# Altium schematic sheet CW341_FPGA_CFG.SchDoc: Kintex CFG
size Letter; Organization: NewAE Technology Inc.; Address1: 1083 Queen St., Suite 196; Address2: Halifax; Address3: NS; Address4: Canada B3H 0B2; SheetNumber: 4; SheetTotal: 16; SheetApproved: YES
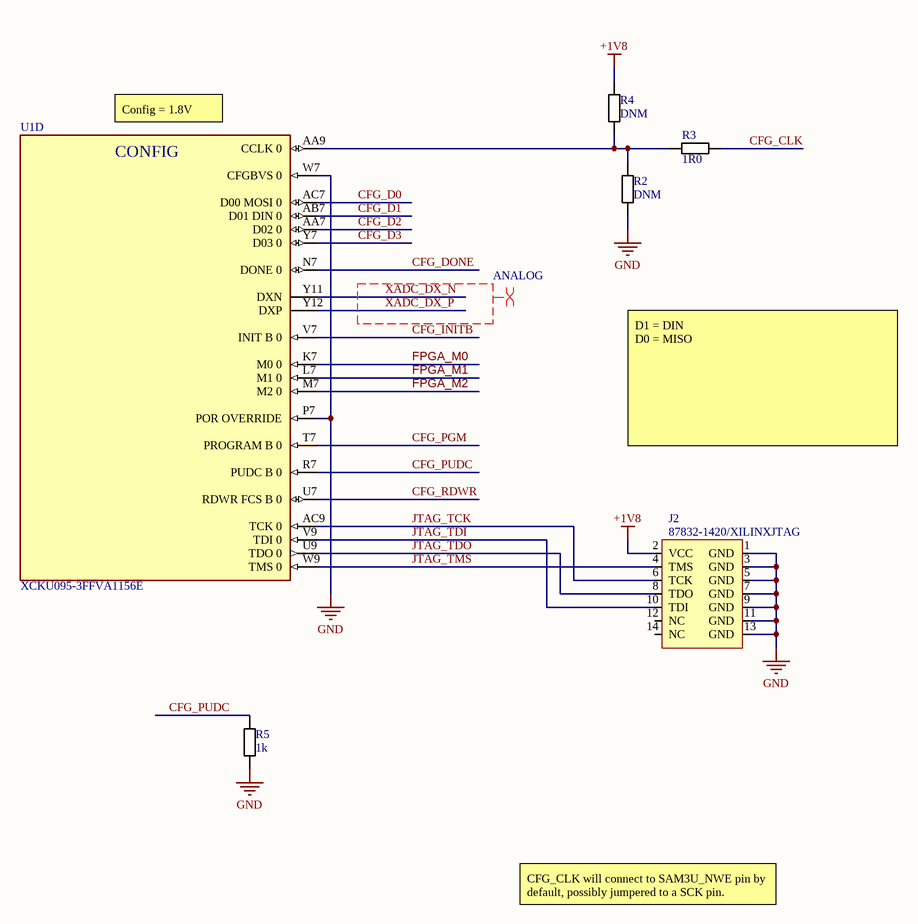
[diagram p0: CW341_FPGA_CFG.SchDoc]

## Parts
J2  87832-1420/XILINXJTAG  [87832-1420]
R2  DNM  [RESC1005X40N]
R3  1R0  [RESC1005X40N]
R4  DNM  [RESC1005X40N]
R5  1k  [RESC1005X40N]
U1  XCKU095-3FFVA1156E  [FP-XCKU060-3FFVA1156E-MFG]  (part D of 23)

## Nets
+1V8: J2.2(VCC) R4.1
GND: J2.1(GND) J2.3(GND) J2.5(GND) J2.7(GND) J2.9(GND) J2.11(GND) J2.13(GND) R2.2 R5.2 U1.P7(POR_OVERRIDE) U1.W7(CFGBVS_0)
CFG_CLK: R3.2
CFG_D0: U1.AC7(D00_MOSI_0)
CFG_D1: U1.AB7(D01_DIN_0)
CFG_D2: U1.AA7(D02_0)
CFG_D3: U1.Y7(D03_0)
CFG_DONE: U1.N7(DONE_0)
CFG_INITB: U1.V7(INIT_B_0)
CFG_PGM: U1.T7(PROGRAM_B_0)
CFG_PUDC: R5.1 U1.R7(PUDC_B_0)
CFG_RDWR: U1.U7(RDWR_FCS_B_0)
FPGA_M0: U1.K7(M0_0)
FPGA_M1: U1.L7(M1_0)
FPGA_M2: U1.M7(M2_0)
JTAG_TCK: J2.6(TCK) U1.AC9(TCK_0)
JTAG_TDI: J2.10(TDI) U1.V9(TDI_0)
JTAG_TDO: J2.8(TDO) U1.U9(TDO_0)
JTAG_TMS: J2.4(TMS) U1.W9(TMS_0)
XADC_DX_N: U1.Y11(DXN)
XADC_DX_P: U1.Y12(DXP)
NetR2_1: R2.1 R3.1 R4.2 U1.AA9(CCLK_0)

Not connected (* = marked no-connect by the designer): J2 12(NC) 14(NC)

## Layout directives
differential pair; differential pair class ANALOG: XADC_DX_N, XADC_DX_P

## Notes on the sheet
- Config = 1.8V
- D1 = DIN
  D0 = MISO
- CFG_CLK will connect to SAM3U_NWE pin by default, possibly jumpered to a SCK pin.
- Title:
- Date:
- Rev:
- Time:
- Project:
- Sheet
- of
- License:
- Copyright © NewAE Technology Inc.
- Approved:
- NewAE.com
- File:
- (in symbol IC-XCKU095-1156, part D) CONFIG

## Library data of the parts
J2 = 87832-1420/XILINXJTAG: Molex 14-pin SMD, JTAG Pinout; Manufacture 1: Molex; Manufacture 1 Part Number: 87832-1420; Supplier 1: Digi-Key; Supplier Part Number 1: WM18641-ND
R2 R4 = RCHIP-DNM-0402: Component Group: Resistor; Case-EIA: 0402; Case-Metric: 1005; Part Number: RCHIP-DNM-0402; Footprint: 0402; Pin Count: 2; Value: DNM; Component Kind: Standard; Component Type: Standard
R3 = RCHIP-1R0-0402: 1R0 res, 0402, 1%, 1/16W; Manufacture 1: Yageo; Manufacture Part Number 1: RC0402FR-071RL; Component Group: Resistor; Case-EIA: 0402; Case-Metric: 1005; Rated Power: 0.063W; Rated Voltage: 75VDC; Part Number: RCHIP-1R0-0402; Footprint: 0402; Pin Count: 2; Supplier 1: Digi-Key; Supplier Part Number 1: 311-1.00LRCT-ND; Value: 1R0; Tolerance: 1%; Mounting Technology: SMT; Temperature Range: -55C to 155C; Component Kind: Standard; Component Type: Standard
R5 = RCHIP-1K-0402: 1k res, 0402, 1%, 1/16W; Manufacture 1: Yageo; Manufacture Part Number 1: RC0402FR-071KL; Component Group: Resistor; Case-EIA: 0402; Case-Metric: 1005; Rated Power: 0.063W; Rated Voltage: 75VDC; Part Number: RCHIP-1K-0402; Footprint: 0402; Pin Count: 2; Supplier 1: Digi-Key; Supplier Part Number 1: 311-1.00KLRCT-ND; Value: 1k; Tolerance: 1%; Mounting Technology: SMT; Temperature Range: -55C to 155C; Component Kind: Standard; Component Type: Standard
U1 = IC-XCKU095-1156: IC FPGA 520 I/O 1156FCBGA; Manufacturer: Xilinx; Manufacturer Part Number: XCKU060-3FFVA1156E; Standoff Height: 0.4mm; Ram Size: 38MBytes; Min Supply Voltage: 0.97V; Max Junction Temp: +100°C; Max Supply Voltage: 1.8V; Number Of Logic Elements Cells: 1176000; Number Of I/Os: 520; Speed Grade: 3; Memory Type: RAM; Ipc Land Pattern Name: BGA1156N100P34X34_3500X3500X342; RoHS: TRUE; Height: 3.51mm; Footprint Url: https://www.xilinx.com/support/documentation/user_guides/ug575-ultrascale-pkg-pinout.pdf; Device Class L2: Embedded Processors and Controllers; ComponentLink2URL: https://www.xilinx.com/support/documentation/data_sheets/ds890-ultrascale-overview.pdf; Temperature Range High: +100°C; Device Class L1: Integrated Circuits (ICs); Package: 0; Octopart: https://octopart.com/xcku035-3ffva1156e-xilinx-67038192?r=sp; Automotive: No; ComponentLink2Description: Datasheet; Device Class L3: FPGAs - Field Programmable Gate Arrays; Category: IC; Lead Free: Yes; Temperature: 0°C to +100°C; Temperature Range Low: 0°C; Digikey Description: IC FPGA 520 I/O 1156FCBGA